# Altium schematic sheet Pad Connections.SchDoc
size A4; SheetNumber: 5; SheetTotal: 6
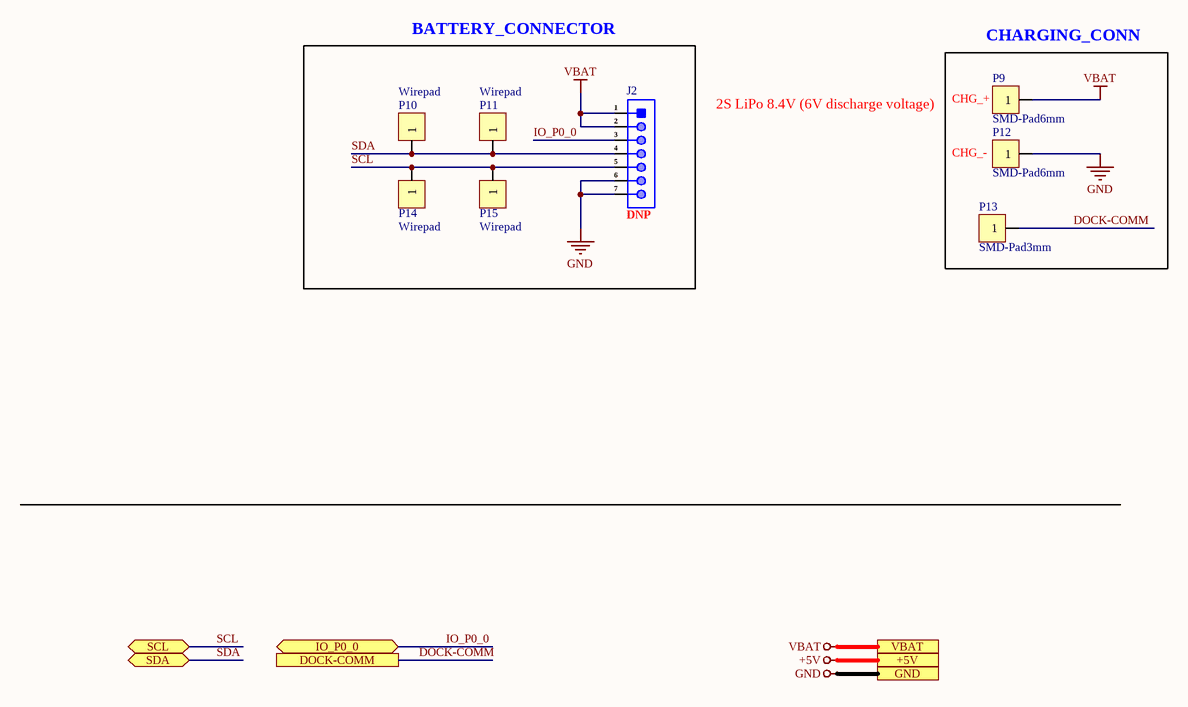
[diagram p0: Pad Connections.SchDoc]

## Parts
J2  DNP  [HDR 1X7]
P9  SMD-Pad6mm  [6.0mm-SMD Pad]  (no BOM)
P10  Wirepad  [Wirepad]
P11  Wirepad  [Wirepad]
P12  SMD-Pad6mm  [6.0mm-SMD Pad]  (no BOM)
P13  SMD-Pad3mm  [3mm SMD PAD]  (no BOM)
P14  Wirepad  [Wirepad]
P15  Wirepad  [Wirepad]

## Blocks framed on the sheet
BATTERY_CONNECTOR: J2 P10 P11 P14 P15
CHARGING_CONN: P9 P12 P13

## Ports
+5V (see Top-Sheet[3B], Connection Powermodule[2D], IO-Extender[3D], MOSFET Driving[2D]), DOCK-COMM (see Top-Sheet[4B], Connection Powermodule[1D]), GND (see Top-Sheet[3B], Connection Powermodule[2D], HMI Part[3D], IO-Extender[3D], MOSFET Driving[2D]), IO_P0_0 (bidir, see Top-Sheet[3C], IO-Extender[2D]), SCL (bidir, see Top-Sheet[3B], Connection Powermodule[1D], IO-Extender[1D]), SDA (bidir, see Top-Sheet[3B], Connection Powermodule[1D], IO-Extender[1D]), VBAT (see Top-Sheet[3B], Connection Powermodule[2D], MOSFET Driving[2D])

## Nets
+5V: port +5V
GND: J2.6 J2.7 P12.1 ; port GND
VBAT: J2.1 J2.2 P9.1 ; port VBAT
DOCK-COMM: P13.1 ; port DOCK-COMM
IO_P0_0: J2.3 ; port IO_P0_0
SCL: J2.5 P14.1 P15.1 ; port SCL
SDA: J2.4 P10.1 P11.1 ; port SDA

## Notes on the sheet
- 2S LiPo 8.4V (6V discharge voltage)
- (near P9) CHG_+
- (near P12) CHG_-
- File:
- Title:
- Date:
- Page
- Num:
- Total:
- Drawn By: Huzaifa Ali

## Library data of the parts
J2 = PZ254V-11-07P: Manufacturer: XFCN; Item Type: Header; Manufacturer Part Number: PZ254V-11-07P; LCSC Part Number: C492406; Package: 2.54mm; ComponentLink1Description: LCSC; ComponentLink1URL: https://www.lcsc.com/product-detail/Pin-Headers_XFCN-PZ254V-11-07P_C492406.html
P13 = SMD-Pad3mm: Wire Conncting PAD